# Altium schematic sheet MCU.SchDoc: Microcontrolador principal
size 420 x 297 mm; Author: Matheus Markies; DrawnBy: Matheus Markies; Engineer: Matheus Markies; DocumentNumber: ECTU-SCH-01; Revision: A definir; SheetNumber: 1; SheetTotal: 12; ProjectTitle: ROUTE ECU / ECTU; DocumentStatus: Em desenvolvimento; DocumentDate: 14/10/2026
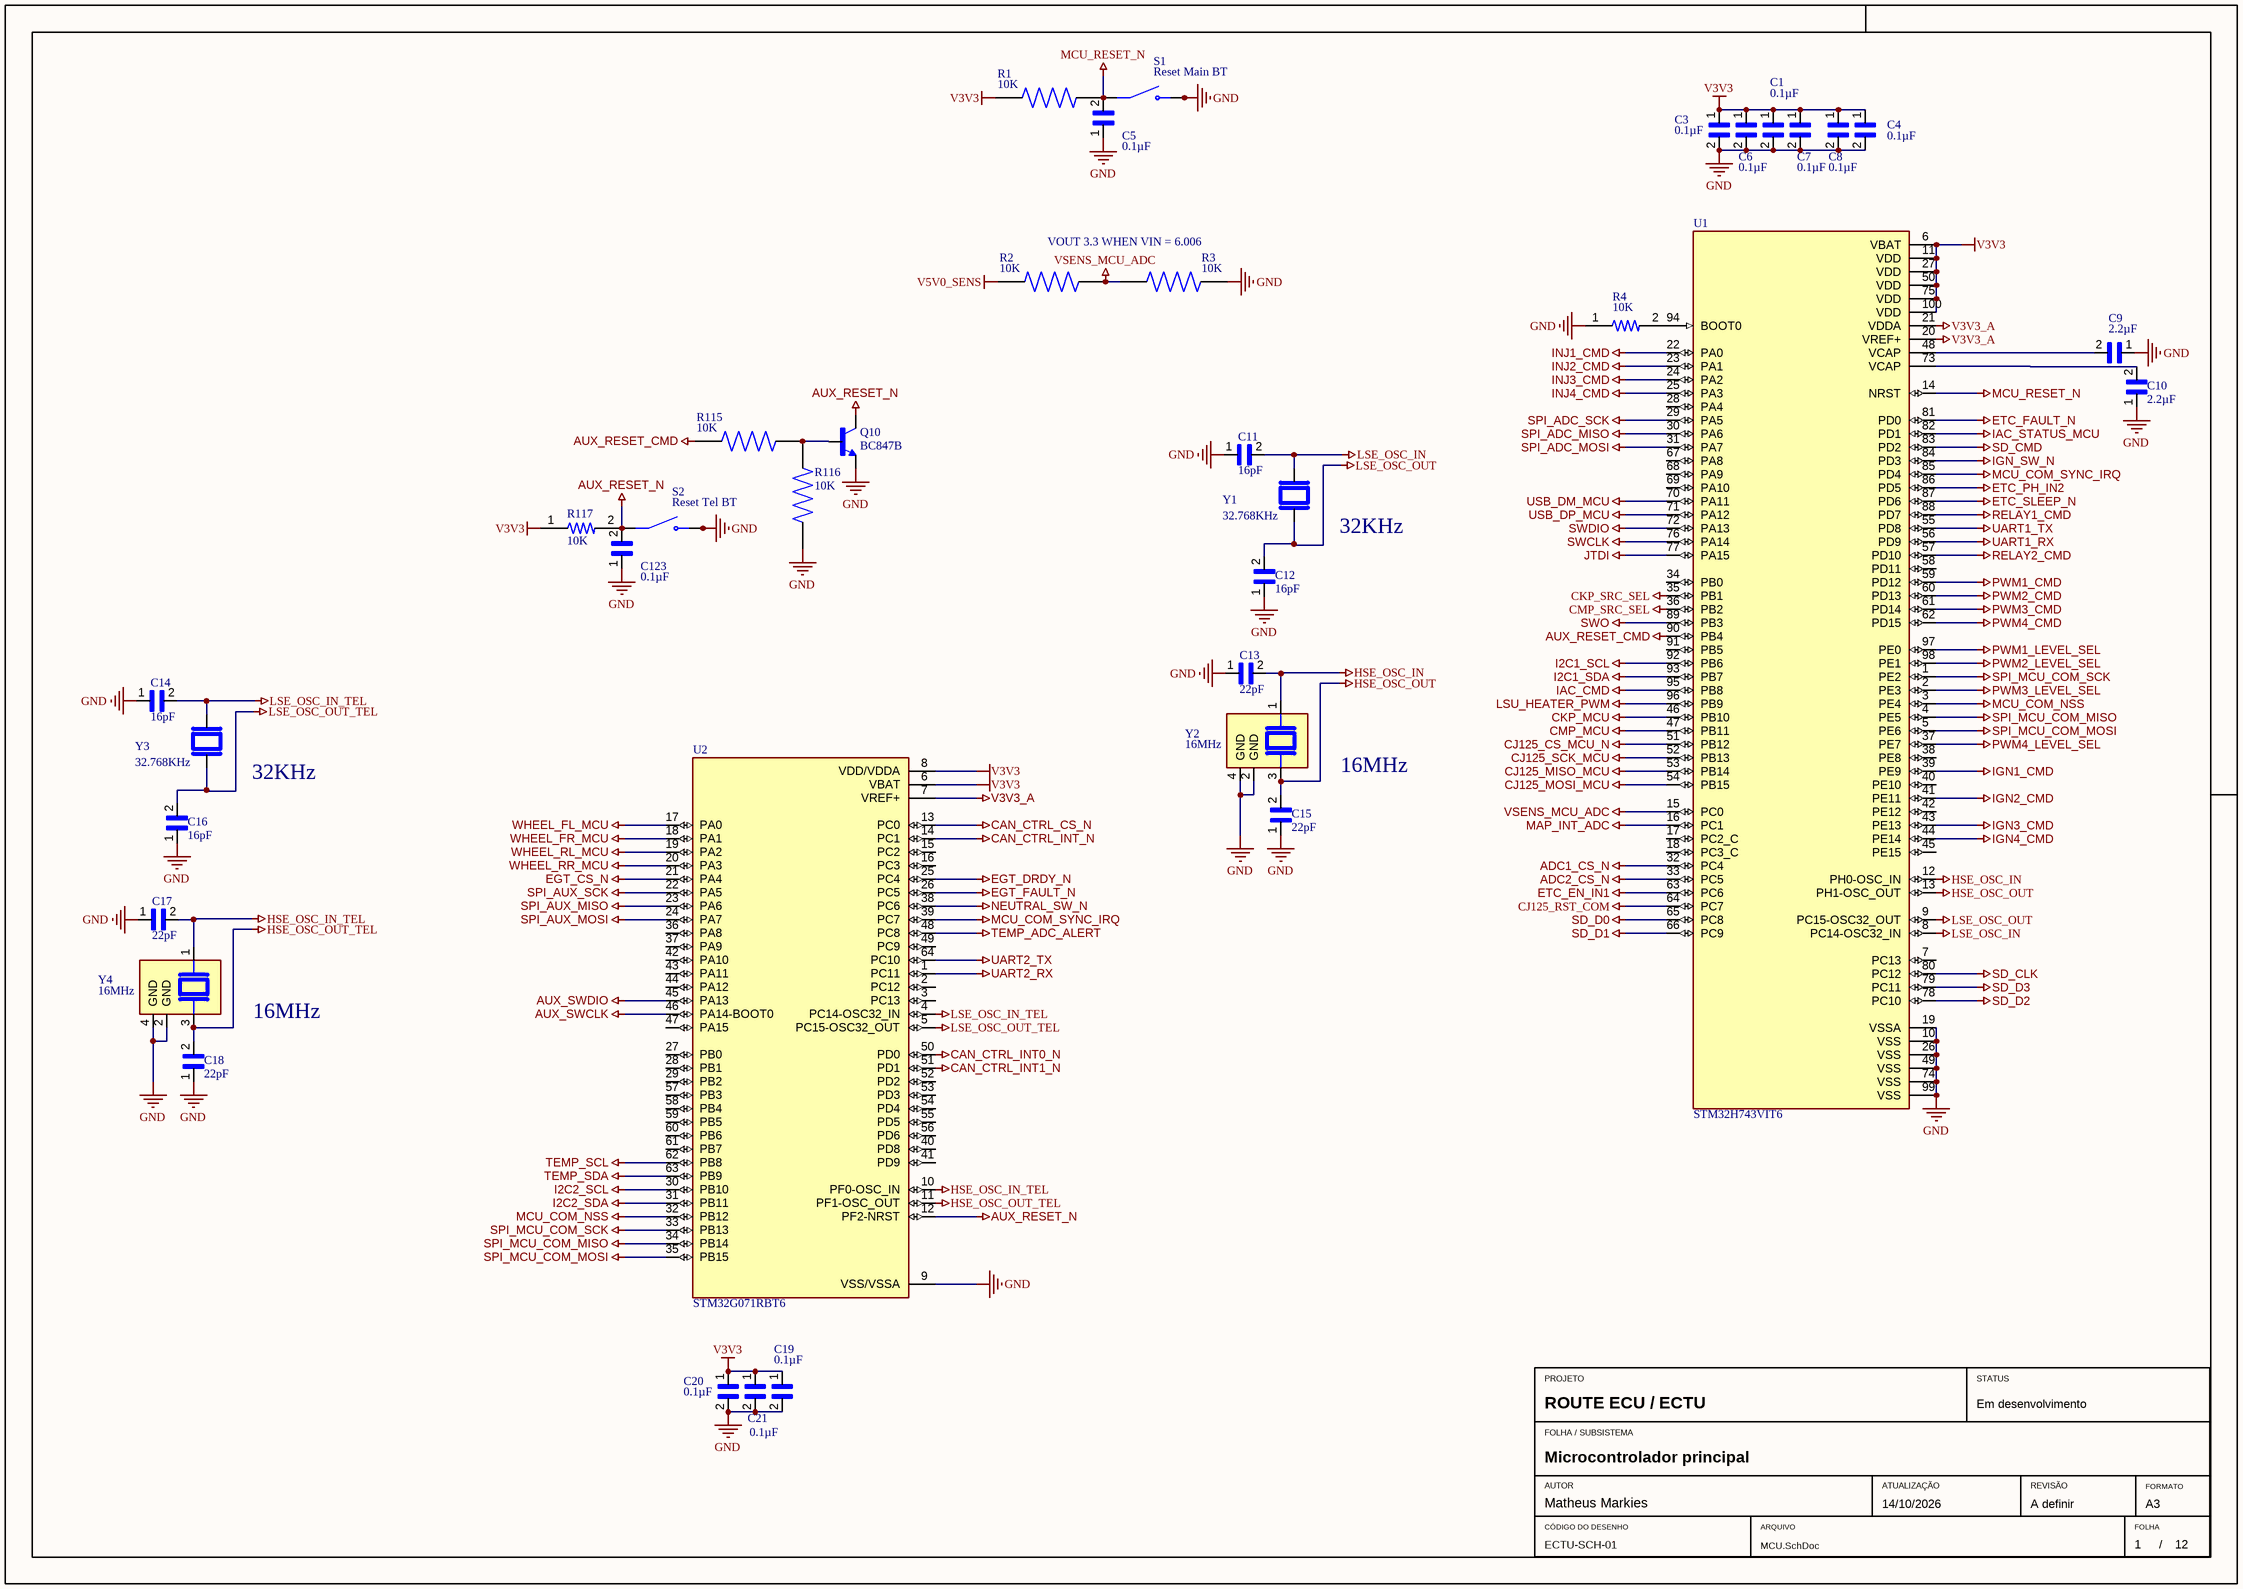
[diagram p0: MCU.SchDoc]

## Parts
C1  0.1µF  [CAPC1608X90N]
C3  0.1µF  [CAPC1608X90N]
C4  0.1µF  [CAPC1608X90N]
C5  0.1µF  [CAPC1608X90N]
C6  0.1µF  [CAPC1608X90N]
C7  0.1µF  [CAPC1608X90N]
C8  0.1µF  [CAPC1608X90N]
C9  2.2µF  [CAPC1608X90N]
C10  2.2µF  [CAPC1608X90N]
C11  16pF  [CAPC1608X90N]
C12  16pF  [CAPC1608X90N]
C13  22pF  [CAPC1608X90N]
C14  16pF  [CAPC1608X90N]
C15  22pF  [CAPC1608X90N]
C16  16pF  [CAPC1608X90N]
C17  22pF  [CAPC1608X90N]
C18  22pF  [CAPC1608X90N]
C19  0.1µF  [CAPC1608X90N]
C20  0.1µF  [CAPC1608X90N]
C21  0.1µF  [CAPC1608X90N]
C123  0.1µF  [CAPC1608X90N]
Q10  BC847B  [TRANS_BC847B]
R1  10K  [RESC3116X65N]
R2  10K  [RESC3116X65N]
R3  10K  [RESC3116X65N]
R4  10K  [RESC1608X50N]
R115  10K  [RESC3116X65N]
R116  10K  [RESC3116X65N]
R117  10K  [RESC1608X50N]
S1  Reset Main BT  [SW_8-1437565-1]
S2  Reset Tel BT  [SW_8-1437565-1]
U1  STM32H743VIT6  [QFP50P1600X1600X160-100N]
U2  STM32G071RBT6  [QFP50P1200X1200X160-64N]
Y1  32.768KHz  [XTAL_ABS06-32.768KHZ-9-1-T]
Y2  16MHz  [XTAL_7M25090002]
Y3  32.768KHz  [XTAL_ABS06-32.768KHZ-9-1-T]
Y4  16MHz  [XTAL_7M25090002]

## Nets
ADC1_CS_N: U1.32(PC4)
ADC2_CS_N: U1.33(PC5)
AUX_RESET_CMD: R115.1 U1.90(PB4)
AUX_RESET_N: C123.2 Q10.3(C) R117.2 S2.1(COM) S2.2(COM) U2.12(PF2-NRST)
AUX_SWCLK: U2.46(PA14-BOOT0)
AUX_SWDIO: U2.45(PA13)
CAN_CTRL_CS_N: U2.13(PC0)
CAN_CTRL_INT0_N: U2.50(PD0)
CAN_CTRL_INT1_N: U2.51(PD1)
CAN_CTRL_INT_N: U2.14(PC1)
CJ125_CS_MCU_N: U1.51(PB12)
CJ125_MISO_MCU: U1.53(PB14)
CJ125_MOSI_MCU: U1.54(PB15)
CJ125_RST_COM: U1.64(PC7)
CJ125_SCK_MCU: U1.52(PB13)
CKP_MCU: U1.46(PB10)
CKP_SRC_SEL: U1.35(PB1)
CMP_MCU: U1.47(PB11)
CMP_SRC_SEL: U1.36(PB2)
EGT_CS_N: U2.21(PA4)
EGT_DRDY_N: U2.25(PC4)
EGT_FAULT_N: U2.26(PC5)
ETC_EN_IN1: U1.63(PC6)
ETC_FAULT_N: U1.81(PD0)
ETC_PH_IN2: U1.86(PD5)
ETC_SLEEP_N: U1.87(PD6)
GND: C1.2 C3.2 C4.2 C5.1 C6.2 C7.2 C8.2 C9.1 C10.1 C11.1 C12.1 C13.1 C14.1 C15.1 C16.1 C17.1 C18.1 C19.2 C20.2 C21.2 C123.1 Q10.2(E) R3.2 R4.1 R116.1 S1.3(NO) S1.4(NO) S2.3(NO) S2.4(NO) U1.10(VSS) U1.19(VSSA) U1.26(VSS) U1.49(VSS) U1.74(VSS) U1.99(VSS) U2.9(VSS/VSSA) Y2.2(GND) Y2.4(GND) Y4.2(GND) Y4.4(GND)
HSE_OSC_IN: C13.2 U1.12(PH0-OSC_IN) Y2.1
HSE_OSC_IN_TEL: C17.2 U2.10(PF0-OSC_IN) Y4.1
HSE_OSC_OUT: C15.2 U1.13(PH1-OSC_OUT) Y2.3
HSE_OSC_OUT_TEL: C18.2 U2.11(PF1-OSC_OUT) Y4.3
I2C1_SCL: U1.92(PB6)
I2C1_SDA: U1.93(PB7)
I2C2_SCL: U2.30(PB10)
I2C2_SDA: U2.31(PB11)
IAC_CMD: U1.95(PB8)
IAC_STATUS_MCU: U1.82(PD1)
IGN1_CMD: U1.39(PE9)
IGN2_CMD: U1.41(PE11)
IGN3_CMD: U1.43(PE13)
IGN4_CMD: U1.44(PE14)
IGN_SW_N: U1.84(PD3)
INJ1_CMD: U1.22(PA0)
INJ2_CMD: U1.23(PA1)
INJ3_CMD: U1.24(PA2)
INJ4_CMD: U1.25(PA3)
JTDI: U1.77(PA15)
LSE_OSC_IN: C11.2 U1.8(PC14-OSC32_IN) Y1.2
LSE_OSC_IN_TEL: C14.2 U2.4(PC14-OSC32_IN) Y3.2
LSE_OSC_OUT: C12.2 U1.9(PC15-OSC32_OUT) Y1.1
LSE_OSC_OUT_TEL: C16.2 U2.5(PC15-OSC32_OUT) Y3.1
LSU_HEATER_PWM: U1.96(PB9)
MAP_INT_ADC: U1.16(PC1)
MCU_COM_NSS: U1.3(PE4) U2.32(PB12)
MCU_COM_SYNC_IRQ: U1.85(PD4) U2.39(PC7)
MCU_RESET_N: C5.2 R1.2 S1.1(COM) S1.2(COM) U1.14(NRST)
NEUTRAL_SW_N: U2.38(PC6)
PWM1_CMD: U1.59(PD12)
PWM1_LEVEL_SEL: U1.97(PE0)
PWM2_CMD: U1.60(PD13)
PWM2_LEVEL_SEL: U1.98(PE1)
PWM3_CMD: U1.61(PD14)
PWM3_LEVEL_SEL: U1.2(PE3)
PWM4_CMD: U1.62(PD15)
PWM4_LEVEL_SEL: U1.37(PE7)
RELAY1_CMD: U1.88(PD7)
RELAY2_CMD: U1.57(PD10)
SD_CLK: U1.80(PC12)
SD_CMD: U1.83(PD2)
SD_D0: U1.65(PC8)
SD_D1: U1.66(PC9)
SD_D2: U1.78(PC10)
SD_D3: U1.79(PC11)
SPI_ADC_MISO: U1.30(PA6)
SPI_ADC_MOSI: U1.31(PA7)
SPI_ADC_SCK: U1.29(PA5)
SPI_AUX_MISO: U2.23(PA6)
SPI_AUX_MOSI: U2.24(PA7)
SPI_AUX_SCK: U2.22(PA5)
SPI_MCU_COM_MISO: U1.4(PE5) U2.34(PB14)
SPI_MCU_COM_MOSI: U1.5(PE6) U2.35(PB15)
SPI_MCU_COM_SCK: U1.1(PE2) U2.33(PB13)
SWCLK: U1.76(PA14)
SWDIO: U1.72(PA13)
SWO: U1.89(PB3)
TEMP_ADC_ALERT: U2.48(PC8)
TEMP_SCL: U2.62(PB8)
TEMP_SDA: U2.63(PB9)
UART1_RX: U1.56(PD9)
UART1_TX: U1.55(PD8)
UART2_RX: U2.1(PC11)
UART2_TX: U2.64(PC10)
USB_DM_MCU: U1.70(PA11)
USB_DP_MCU: U1.71(PA12)
V3V3: C1.1 C3.1 C4.1 C6.1 C7.1 C8.1 C19.1 C20.1 C21.1 R1.1 R117.1 U1.6(VBAT) U1.11(VDD) U1.27(VDD) U1.50(VDD) U1.75(VDD) U1.100(VDD) U2.6(VBAT) U2.8(VDD/VDDA)
V3V3_A: U1.20(VREF+) U1.21(VDDA) U2.7(VREF+)
V5V0_SENS: R2.1
VSENS_MCU_ADC: R2.2 R3.1 U1.15(PC0)
WHEEL_FL_MCU: U2.17(PA0)
WHEEL_FR_MCU: U2.18(PA1)
WHEEL_RL_MCU: U2.19(PA2)
WHEEL_RR_MCU: U2.20(PA3)
NetC9_2: C9.2 U1.48(VCAP)
NetC10_2: C10.2 U1.73(VCAP)
NetQ10_1: Q10.1(B) R115.2 R116.2
NetR4_2: R4.2 U1.94(BOOT0)

Not connected (* = marked no-connect by the designer): U1 7(PC13) 17(PC2_C) 18(PC3_C) 28(PA4) 34(PB0) 38(PE8) 40(PE10) 42(PE12) 45(PE15) 58(PD11) 67(PA8) 68(PA9) 69(PA10) 91(PB5); U2 2(PC12) 3(PC13) 15(PC2) 16(PC3) 27(PB0) 28(PB1) 29(PB2) 36(PA8) 37(PA9) 40(PD8) 41(PD9) 42(PA10) 43(PA11) 44(PA12) 47(PA15) 49(PC9) 52(PD2) 53(PD3) 54(PD4) 55(PD5) 56(PD6) 57(PB3) 58(PB4) 59(PB5) 60(PB6) 61(PB7)

## Notes on the sheet
- VOUT 3.3 WHEN VIN = 6.006
- (near Y1) 32KHz
- (near Y3) 32KHz
- 16MHz
- PROJETO
- STATUS
- FOLHA / SUBSISTEMA
- AUTOR
- CÓDIGO DO DESENHO
- ARQUIVO
- ATUALIZAÇÃO
- REVISÃO
- FOLHA
- FORMATO
- A3
- /

## Library data of the parts
C1 C3-C21 C123 = 06035C104MAZ2A: Multilayer Ceramic Capacitors MLCC - SMD/SMT; Package: None; Price: None; Value: *; MP: 06035C104MAZ2A; Availability: Unavailable
Q10 = BC847B: BJT, SOT-23, 45V, 100mA, NPN, 0.25W, 150Â°C; MF: Diotec Semiconductor; SnapEDA_Link: https://www.snapeda.com/parts/BC847B/Diotec/view-part/?ref=snap; Package: SOT-23 Diotec; Value: *; MP: BC847B; Check_prices: https://www.snapeda.com/parts/BC847B/Diotec/view-part/?ref=eda
R1-R3 R115 R116 = AA1206JR-07470RL: Package: None; Price: None; Value: *; MP: AA1206JR-07470RL; Availability: Unavailable
R4 R117 = RP73PF1J10KBTDF: Thin Film Resistors - SMD 10K OHM .1% 25PPM; Voltage_Rating: 75 V; Power_Rating: .166 W; MF: TE Connectivity; Mouser-Purchase-URL: https://snapeda.com/shop?store=Mouser&id=550687; Value: *; SnapEDA_Link: https://www.snapeda.com/parts/RP73PF1J10KBTDF/TE%20Connectivity%20Passive%20Product/view-part/550687/?ref=snap; MP: RP73PF1J10KBTDF; Tolerance: .1%; Digi-Key_Part_Number: A110204CT-ND; Resistance: 10K; Package: 0603
S1 S2 = 8-1437565-1: Package: None; MP: 8-1437565-1; Price: None; Availability: Unavailable; Value: *
U1 = STM32H743VIT6: ARMÂ® CortexÂ®-M7 STM32H7 Microcontroller IC 32-Bit Single-Core 480MHz 2MB (2M x 8) FLASH 100-LQFP (14x14); MF: STMicroelectronics; SnapEDA_Link: https://www.snapeda.com/parts/STM32H743VIT6/STMicroelectronics/view-part/?ref=snap; Package: LQFP-100 STMicroelectronics; Value: *; MP: STM32H743VIT6; Check_prices: https://www.snapeda.com/parts/STM32H743VIT6/STMicroelectronics/view-part/?ref=eda
U2 = STM32G071RBT6: ARMÂ® CortexÂ®-M0+ STM32G0 Microcontroller IC 32-Bit Single-Core 64MHz 128KB (128K x 8) FLASH 64-LQFP (10x10); MF: STMicroelectronics; SnapEDA_Link: https://www.snapeda.com/parts/STM32G071RBT6/STMicroelectronics/view-part/?ref=snap; Package: LQFP-64 STMicroelectronics; Value: *; MP: STM32G071RBT6; Check_prices: https://www.snapeda.com/parts/STM32G071RBT6/STMicroelectronics/view-part/?ref=eda
Y1 Y3 = ABS06-32.768KHZ-9-1-T: 32.768 kHz Â±10ppm Crystal 9pF 90 kOhms 2-SMD, No Lead; MF: Abracon; Availability: In Stock; Value: *; Purchase-URL: https://pricing.snapeda.com/search/part/ABS06-32.768KHZ-9-1-T/?ref=eda; Price: None; Check_prices: https://www.snapeda.com/parts/ABS06-32.768KHZ-9-1-T/Abracon+LLC/view-part/?ref=eda; MP: ABS06-32.768KHZ-9-1-T; Package: SMD-2 Abracon LLC; SnapEDA_Link: https://www.snapeda.com/parts/ABS06-32.768KHZ-9-1-T/Abracon+LLC/view-part/?ref=snap
Y2 Y4 = 7M25090002: 25 MHz Â±10ppm Crystal 18pF 4-SMD, No Lead; MF: TXC; Availability: In Stock; Check_prices: https://www.snapeda.com/parts/7M25090002/TXC/view-part/?ref=eda; Price: None; SnapEDA_Link: https://www.snapeda.com/parts/7M25090002/TXC/view-part/?ref=snap; MP: 7M25090002; Value: *; Purchase-URL: https://pricing.snapeda.com/search/part/7M25090002/?ref=eda; Package: SMD-4 TXC